# Altium schematic sheet servo_shield.schdoc
size 420 x 297 mm; Symbol: Drawing-Symbol_A4; Company: 嘉立创EDA; Version: V1.0; Page Size: A4; @Project Name: RobotDog_ServoShield; @Page Count: 1; @Update Date: 2025-12-03; @Create Date: 2025-11-25; @Schematic Name: Schematic1; @Page No: 1; @Page Name: P1; @Board Name: Board1; @Create Time: 19:45:21; @Update Time: 12:55:40; Border: 1; Title Block Position: 3; Size: A4; Width: 1655; Height: 1170; Region Start: 1; X Region Count: 6; Y Region Count: 4; Blade Width: 10; Title Block: 1; Device: Drawing-Symbol_A4
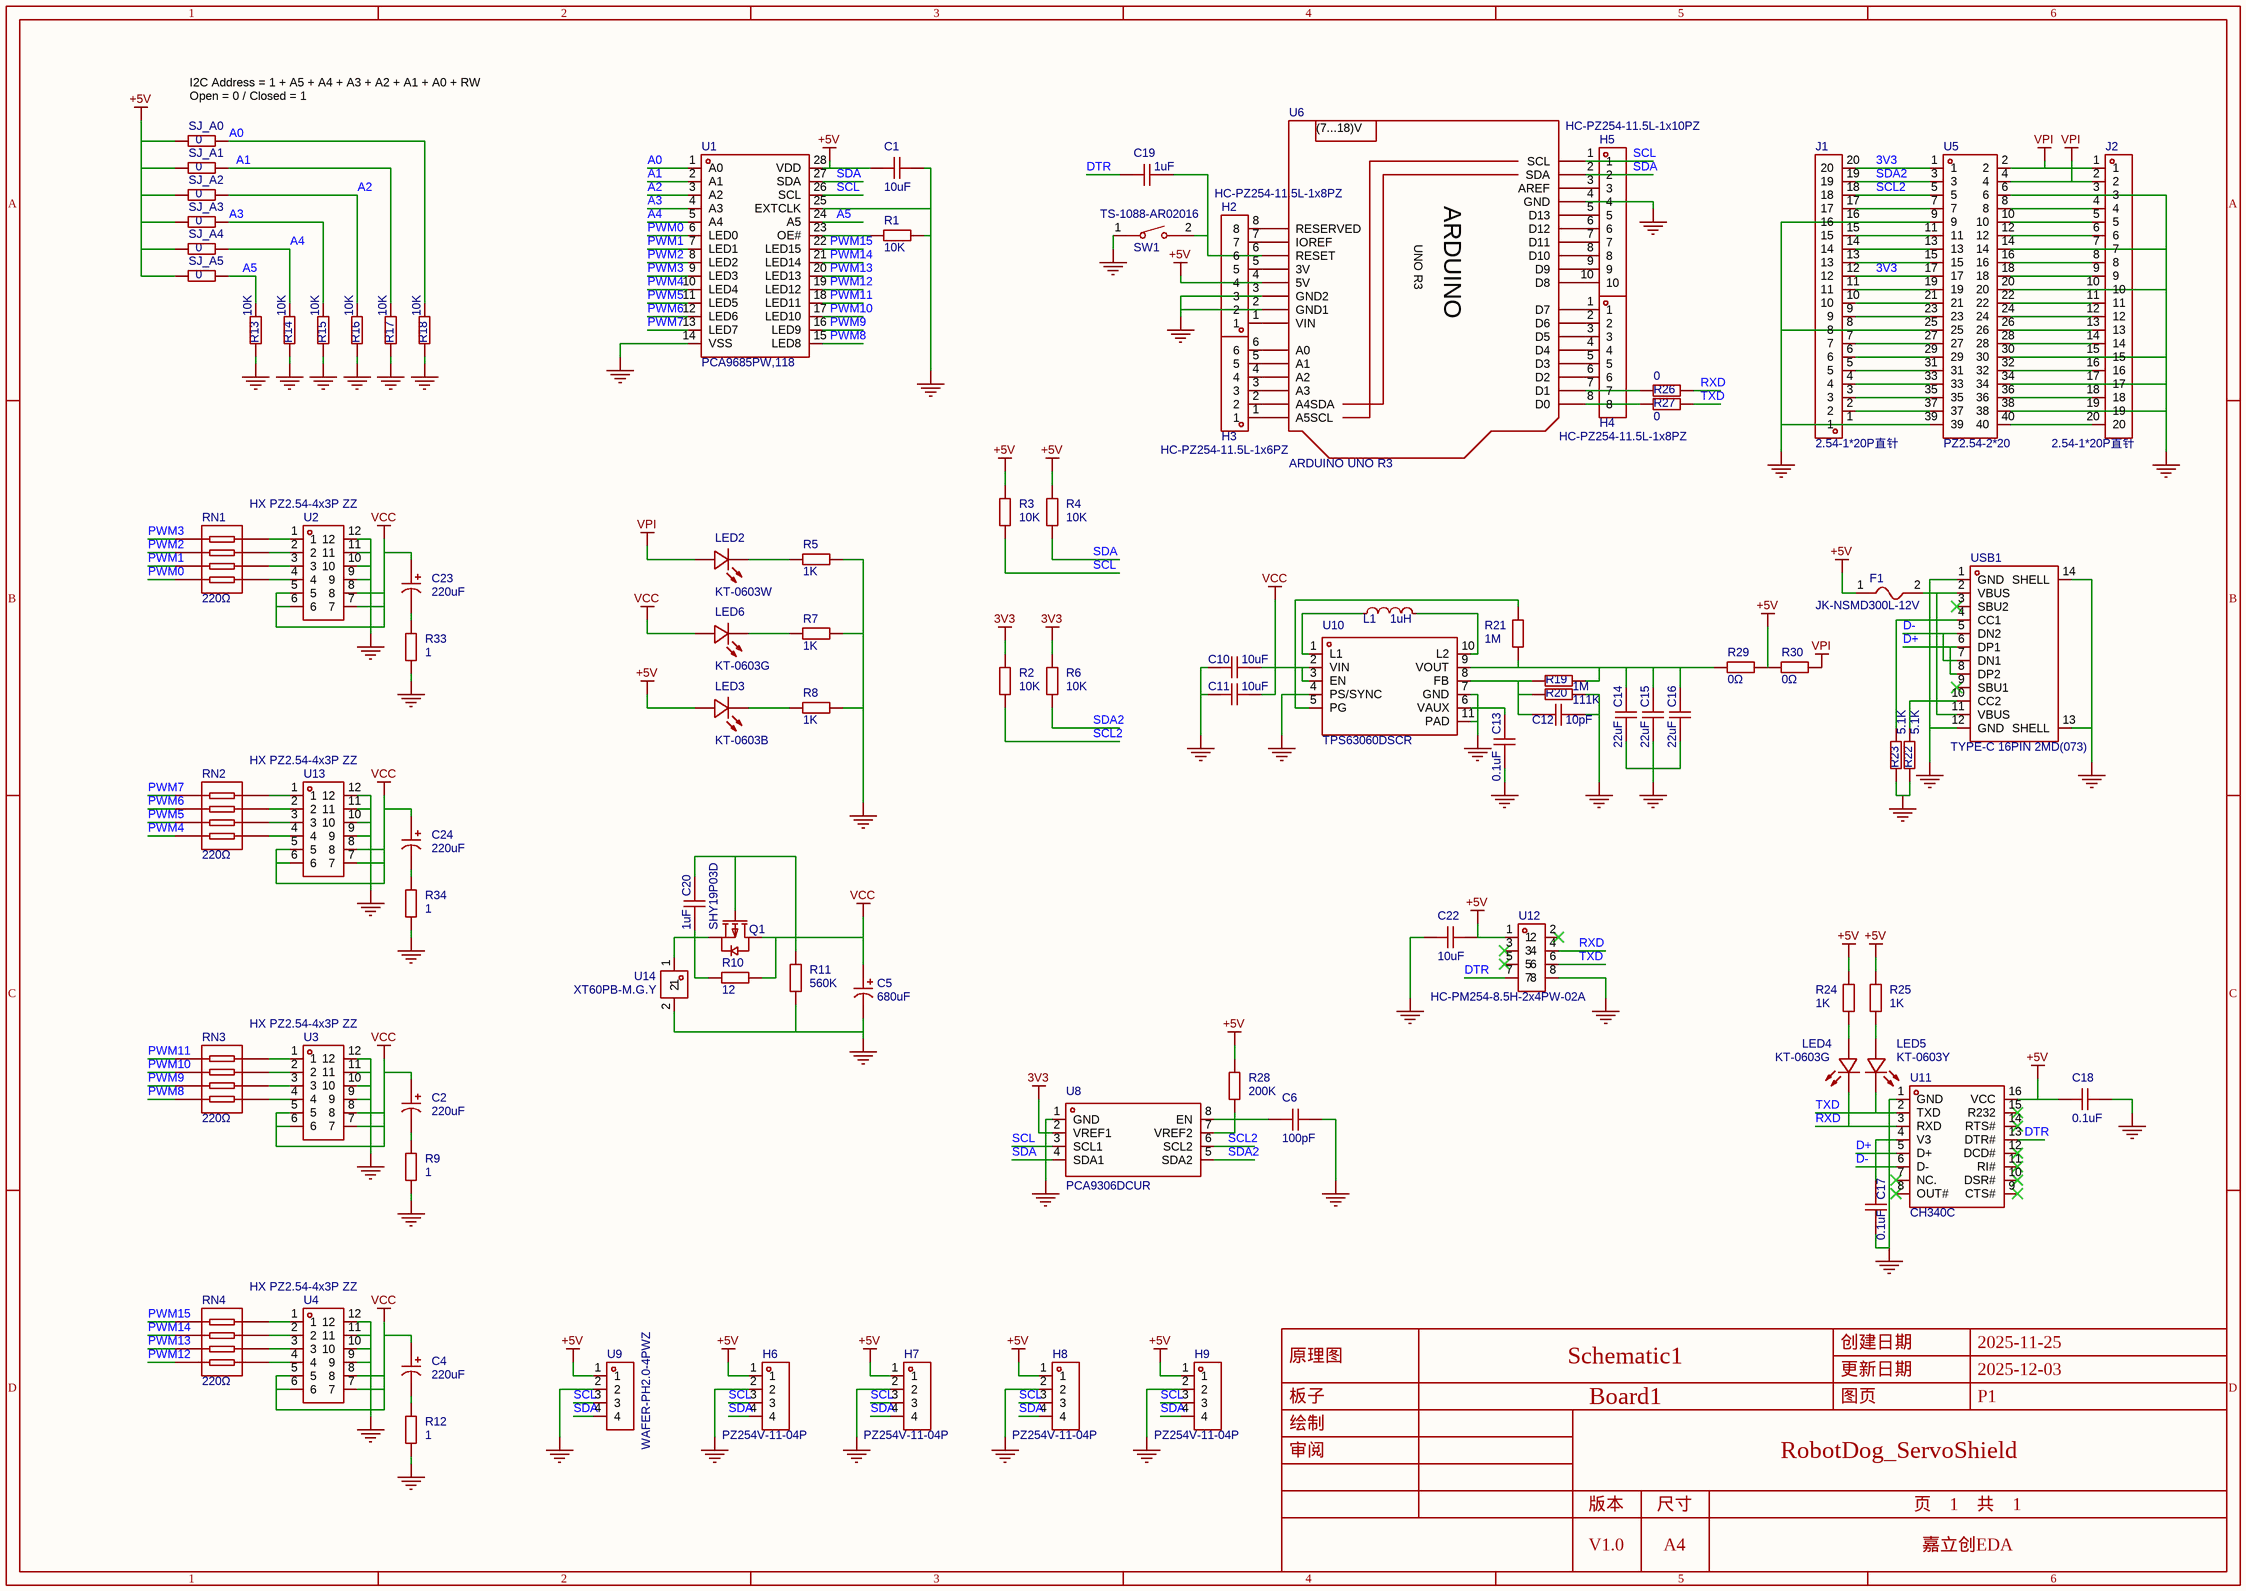
[diagram p0: servo_shield.schdoc]

## Parts
C1  10uF  [C0603]
C2  220uF  [CAP-TH_BD6.3-P2.50-D0.6-FD-1]
C4  220uF  [CAP-TH_BD6.3-P2.50-D0.6-FD-1]
C5  680uF  [CAP-TH_BD8.0-P3.50-D0.6-FD]
C6  100pF  [C0603]
C10  10uF  [C0603]
C11  10uF  [C0603]
C12  10pF  [C0603]
C13  0.1uF  [C0603]
C14  22uF  [C0603]
C15  22uF  [C0603]
C16  22uF  [C0603]
C17  0.1uF  [C0603]
C18  0.1uF  [C0603]
C19  1uF  [C0603]
C20  1uF  [C0603]
C22  10uF  [C0603]
C23  220uF  [CAP-TH_BD6.3-P2.50-D0.6-FD-1]
C24  220uF  [CAP-TH_BD6.3-P2.50-D0.6-FD-1]
F1  JK-NSMD300L-12V  [F1206]
H2  HC-PZ254-11.5L-1x8PZ  [HDR-TH_8P-P2.54-V-M]
H3  HC-PZ254-11.5L-1x6PZ  [HDR-TH_6P-P2.54-V-M]
H4  HC-PZ254-11.5L-1x8PZ  [HDR-TH_8P-P2.54-V-M]
H5  HC-PZ254-11.5L-1x10PZ  [HDR-TH_10P-P2.54-V-M]
H6  PZ254V-11-04P  [HDR-TH_4P-P2.54-V-M]
H7  PZ254V-11-04P  [HDR-TH_4P-P2.54-V-M]
H8  PZ254V-11-04P  [HDR-TH_4P-P2.54-V-M]
H9  PZ254V-11-04P  [HDR-TH_4P-P2.54-V-M]
J1  2.54-1*20P直针  [HDR-TH_20P-P2.54-V-M-1]
J2  2.54-1*20P直针  [HDR-TH_20P-P2.54-V-M-1]
L1  1uH  [L0603]
LED2  KT-0603W  [LED0603-R-RD_WHITE]
LED3  KT-0603B  [LED0603-RD]
LED4  KT-0603G  [LED0603-RD]
LED5  KT-0603Y  [LED0603-R-RD]
LED6  KT-0603G  [LED0603-RD]
Q1  SHY19P03D  [TO-252-2_L6.6-W6.1-P4.60-LS10.0-BR-CW]
R1  10K  [R0603]
R2  10K  [R0603]
R3  10K  [R0603]
R4  10K  [R0603]
R5  1K  [R0603]
R6  10K  [R0603]
R7  1K  [R0603]
R8  1K  [R0603]
R9  1  [R0603]
R10  12  [R0603]
R11  560K  [R0603]
R12  1  [R0603]
R13  10K  [R0603]
R14  10K  [R0603]
R15  10K  [R0603]
R16  10K  [R0603]
R17  10K  [R0603]
R18  10K  [R0603]
R19  1M  [R0603]
R20  111K  [R0603]
R21  1M  [R0603]
R22  5.1K  [R0603]
R23  5.1K  [R0603]
R24  1K  [R0603]
R25  1K  [R0603]
R26  0  [R0603]
R27  0  [R0603]
R28  200K  [R0603]
R29  0Ω  [R0603]
R30  0Ω  [R0603]
R33  1  [R0603]
R34  1  [R0603]
RN1  220Ω  [RES-ARRAY-SMD_0603-8P-L3.2-W1.6-BL]
RN2  220Ω  [RES-ARRAY-SMD_0603-8P-L3.2-W1.6-BL]
RN3  220Ω  [RES-ARRAY-SMD_0603-8P-L3.2-W1.6-BL]
RN4  220Ω  [RES-ARRAY-SMD_0603-8P-L3.2-W1.6-BL]
SJ_A0  0  [R0603]
SJ_A1  0  [R0603]
SJ_A2  0  [R0603]
SJ_A3  0  [R0603]
SJ_A4  0  [R0603]
SJ_A5  0  [R0603]
SW1  TS-1088-AR02016  [SW-SMD_L3.9-W3.0-P4.45]
U1  PCA9685PW,118  [TSSOP-28_L9.7-W4.4-P0.65-LS6.4-TL]
U2  HX PZ2.54-4x3P ZZ  [HDR-TH_12P-P2.54-V-M-R4-C3-S2.54]
U3  HX PZ2.54-4x3P ZZ  [HDR-TH_12P-P2.54-V-M-R4-C3-S2.54]
U4  HX PZ2.54-4x3P ZZ  [HDR-TH_12P-P2.54-V-M-R4-C3-S2.54]
U5  PZ2.54-2*20  [HDR-TH_40P-P2.54-V-M-R2-C20-S2.54]
U6  ARDUINO UNO R3  [ARDUINOR3]
U8  PCA9306DCUR  [SSOP-8_L2.0-W2.3-P0.50-LS3.1-BR]
U9  WAFER-PH2.0-4PWZ  [CONN-TH_4P-P2.00_BX-PH2.0-4PWZ]
U10  TPS63060DSCR  [WSON-10_L3.0-W3.0-P0.50-BL-EP-A]
U11  CH340C  [SOP-16_L10.0-W3.9-P1.27-LS6.0-BL]
U12  HC-PM254-8.5H-2x4PW-02A  [HDR-TH_8P-P2.54-H-F-R2-C4-S2.54-W8.5]
U13  HX PZ2.54-4x3P ZZ  [HDR-TH_12P-P2.54-V-M-R4-C3-S2.54]
U14  XT60PB-M.G.Y  [CONN-TH_XT60PB-M]
USB1  TYPE-C 16PIN 2MD(073)  [USB-C-SMD_TYPE-C-6PIN-2MD-073]

## Nets
3V3: J1.12 J1.20 R2.2 R6.2 U5.1 U5.17 U8.2(VREF1)
+5V: C1.1 C18.1 C22.2 F1.1 H2.4 H6.1 H7.1 H8.1 H9.1 LED3.2(A) R3.2 R4.2 R24.2 R25.2 R28.2 R29.2 R30.1 SJ_A0.1 SJ_A1.1 SJ_A2.1 SJ_A3.1 SJ_A4.1 SJ_A5.1 U1.28(VDD) U6.5V U9.1 U11.16(VCC) U12.1
GND: C1.2 C5.2 C6.2 C10.2 C11.2 C12.1 C13.1 C14.1 C15.1 C16.1 C17.1 C18.2 C22.1 H2.2 H2.3 H5.4 H6.2 H7.2 H8.2 H9.2 J1.1 J1.8 J1.16 J2.3 J2.7 J2.10 J2.15 J2.17 J2.19 R1.2 R5.2 R7.2 R8.2 R9.1 R11.1 R12.1 R13.1 R14.1 R15.1 R16.1 R17.1 R18.1 R20.2 R22.1 R23.1 R33.1 R34.1 SW1.1 U1.14(VSS) U1.25(EXTCLK) U2.9 U2.10 U2.11 U2.12 U3.9 U3.10 U3.11 U3.12 U4.9 U4.10 U4.11 U4.12 U5.6 U5.9 U5.14 U5.20 U5.25 U5.30 U5.34 U5.38 U5.39 U6.GND U6.GND1 U6.GND2 U8.1(GND) U9.2 U10.4(PS/SYNC) U10.7(GND) U10.11(PAD) U11.1(GND) U12.8 U13.9 U13.10 U13.11 U13.12 U14.2 USB1.1(GND) USB1.12(GND) USB1.13(SHELL) USB1.14(SHELL)
VCC: C2.1 C4.1 C5.1 C10.1 C11.1 C23.1 C24.1 LED6.2(A) Q1.2(D) R10.1 U2.5 U2.6 U2.7 U2.8 U3.5 U3.6 U3.7 U3.8 U4.5 U4.6 U4.7 U4.8 U10.2(VIN) U10.3(EN) U13.5 U13.6 U13.7 U13.8
VPI: J2.1 J2.2 LED2.1(A) R30.2 U5.2 U5.4
A0: R18.2 SJ_A0.2 U1.1(A0)
A1: R17.2 SJ_A1.2 U1.2(A1)
A2: R16.2 SJ_A2.2 U1.3(A2)
A3: R15.2 SJ_A3.2 U1.4(A3)
A4: R14.2 SJ_A4.2 U1.5(A4)
A5: R13.2 SJ_A5.2 U1.24(A5)
D+: U11.5(D+) USB1.6(DP1) USB1.8(DP2)
D-: U11.6(D-) USB1.5(DN2) USB1.7(DN1)
DTR: C19.1 U11.13(DTR#) U12.7
PWM0: RN1.4 U1.6(LED0)
PWM1: RN1.3 U1.7(LED1)
PWM2: RN1.2 U1.8(LED2)
PWM3: RN1.1 U1.9(LED3)
PWM4: RN2.4 U1.10(LED4)
PWM5: RN2.3 U1.11(LED5)
PWM6: RN2.2 U1.12(LED6)
PWM7: RN2.1 U1.13(LED7)
PWM8: RN3.4 U1.15(LED8)
PWM9: RN3.3 U1.16(LED9)
PWM10: RN3.2 U1.17(LED10)
PWM11: RN3.1 U1.18(LED11)
PWM12: RN4.4 U1.19(LED12)
PWM13: RN4.3 U1.20(LED13)
PWM14: RN4.2 U1.21(LED14)
PWM15: RN4.1 U1.22(LED15)
RXD: LED4.1(K) R26.2 U11.3(RXD) U12.4
SCL: H5.1 H6.3 H7.3 H8.3 H9.3 R3.1 U1.26(SCL) U6.SCL U8.3(SCL1) U9.3
SCL2: J1.18 R2.1 U5.5 U8.6(SCL2)
SDA: H5.2 H6.4 H7.4 H8.4 H9.4 R4.1 U1.27(SDA) U6.SDA U8.4(SDA1) U9.4
SDA2: J1.19 R6.1 U5.3 U8.5(SDA2)
TXD: LED5.2(K) R27.2 U11.2(TXD) U12.6
NetC2_2: C2.2 R9.2
NetC4_2: C4.2 R12.2
NetC6_1: C6.1 R28.1 U8.7(VREF2) U8.8(EN)
NetC12_2: C12.2 R19.1 R20.1 U10.8(FB)
NetC13_2: C13.2 U10.6(VAUX)
NetC14_2: C14.2 C15.2 C16.2 R19.2 R21.1 R29.1 U10.9(VOUT)
NetC17_2: C17.2 U11.4(V3)
NetC19_2: C19.2 H2.6 SW1.2 U6.RESET
NetC20_1: C20.1 Q1.3(S) R10.2 U14.1
NetC20_2: C20.2 Q1.1(G) R11.2
NetC23_2: C23.2 R33.2
NetC24_2: C24.2 R34.2
NetF1_2: F1.2 USB1.2(VBUS) USB1.11(VBUS)
NetH2_1: H2.1 U6.VIN
NetH2_5: H2.5 U6.3V
NetH2_7: H2.7 U6.IOREF
NetH2_8: H2.8 U6.RESERVED
NetH3_1: H3.1 U6.A5(A5SCL)
NetH3_2: H3.2 U6.A4(A4SDA)
NetH3_3: H3.3 U6.A3
NetH3_4: H3.4 U6.A2
NetH3_5: H3.5 U6.A1
NetH3_6: H3.6 U6.A0
NetH4_1: H4.1 U6.D7
NetH4_2: H4.2 U6.D6
NetH4_3: H4.3 U6.D5
NetH4_4: H4.4 U6.D4
NetH4_5: H4.5 U6.D3
NetH4_6: H4.6 U6.D2
NetH4_7: H4.7 R26.1 U6.D1
NetH4_8: H4.8 R27.1 U6.D0
NetH5_3: H5.3 U6.AREF
NetH5_5: H5.5 U6.D13
NetH5_6: H5.6 U6.D12
NetH5_7: H5.7 U6.D11
NetH5_8: H5.8 U6.D10
NetH5_9: H5.9 U6.D9
NetH5_10: H5.10 U6.D8
NetJ1_2: J1.2 U5.37
NetJ1_3: J1.3 U5.35
NetJ1_4: J1.4 U5.33
NetJ1_5: J1.5 U5.31
NetJ1_6: J1.6 U5.29
NetJ1_7: J1.7 U5.27
NetJ1_9: J1.9 U5.23
NetJ1_10: J1.10 U5.21
NetJ1_11: J1.11 U5.19
NetJ1_13: J1.13 U5.15
NetJ1_14: J1.14 U5.13
NetJ1_15: J1.15 U5.11
NetJ1_17: J1.17 U5.7
NetJ2_4: J2.4 U5.8
NetJ2_5: J2.5 U5.10
NetJ2_6: J2.6 U5.12
NetJ2_8: J2.8 U5.16
NetJ2_9: J2.9 U5.18
NetJ2_11: J2.11 U5.22
NetJ2_12: J2.12 U5.24
NetJ2_13: J2.13 U5.26
NetJ2_14: J2.14 U5.28
NetJ2_16: J2.16 U5.32
NetJ2_18: J2.18 U5.36
NetJ2_20: J2.20 U5.40
NetL1_1: L1.1 U10.1(L1)
NetL1_2: L1.2 U10.10(L2)
NetLED2_2: LED2.2(K) R5.1
NetLED3_1: LED3.1(K) R8.1
NetLED4_2: LED4.2(A) R24.1
NetLED5_1: LED5.1(A) R25.1
NetLED6_1: LED6.1(K) R7.1
NetR1_1: R1.1 U1.23(OE#)
NetR21_2: R21.2 U10.5(PG)
NetR22_2: R22.2 USB1.10(CC2)
NetR23_2: R23.2 USB1.4(CC1)
NetRN1_5: RN1.5 U2.4
NetRN1_6: RN1.6 U2.3
NetRN1_7: RN1.7 U2.2
NetRN1_8: RN1.8 U2.1
NetRN2_5: RN2.5 U13.4
NetRN2_6: RN2.6 U13.3
NetRN2_7: RN2.7 U13.2
NetRN2_8: RN2.8 U13.1
NetRN3_5: RN3.5 U3.4
NetRN3_6: RN3.6 U3.3
NetRN3_7: RN3.7 U3.2
NetRN3_8: RN3.8 U3.1
NetRN4_5: RN4.5 U4.4
NetRN4_6: RN4.6 U4.3
NetRN4_7: RN4.7 U4.2
NetRN4_8: RN4.8 U4.1

Not connected (* = marked no-connect by the designer): U11 7(NC.)* 8(OUT#)* 9(CTS#)* 10(DSR#)* 11(RI#)* 12(DCD#)* 14(RTS#)* 15(R232)*; U12 2* 3* 5*; USB1 3(SBU2)* 9(SBU1)*

## Notes on the sheet
- I2C Address = 1 + A5 + A4 + A3 + A2 + A1 + A0 + RW
  Open = 0 / Closed = 1
- 1
- 2
- 3
- 4
- 5
- 6
- A
- B
- C
- 创建日期
- 2025-11-25
- D
- 原理图
- 板子
- Schematic1
- Board1
- 更新日期
- 图页
- 2025-12-03
- P1
- 绘制
- 审阅
- RobotDog_ServoShield
- 版本
- V1.0
- 尺寸
- A4
- 页    1    共    1
- 嘉立创EDA
- (in symbol ARDUINO UNO R3) (7...18)V; ARDUINO; UNO R3

## Library data of the parts
C1 C10-C19 = CAP_0603: ConvertToPcb: yes; SymbolName: Capacitance; ModelId: ac125912035d415993ca9572d50418b1; ModelName: C0603_L1.6-W0.8-H0.8; ModelTransform: 62.992,31.496,0,0,0,0,0,0,0; Device: CAP_0603; AddInBom: yes; Supplier Footprint: 0603; FootprintName: C0603
  C1 C10 C11: Value: 10uF
  C12: Value: 10pF
  C13 C17 C18: Value: 0.1uF
  C14-C16: Value: 22uF
  C19: Value: 1uF
C2 C4 C23 C24 = PA25V220M6x8: 容值:220uF;精度:±20%;额定电压:25V;纹波电流:2.9A@100kHz;等效串联电阻(ESR):25mΩ@100kHz;类型:聚合物;; Manufacturer: JIERR(捷而瑞); AddInBom: yes; ModelId: c2609a67fafc443cb408b115f2cfd21c; ModelTransform: 247.85521,247.943,0,0,0,0,0,0,-196.85; Tolerance: ±20%; Voltage Rating: 25V; Type: 聚合物; Lifetime: 2000hrs@105℃; Symbol: PA25V220M6X8; Device: PA25V220M6x8; LCSC Part Name: 220uF ±20% 25V; SupplierPart: C46550441; ManufacturerPart: PA25V220M6x8; Supplier Footprint: 插件,D6.3xL8mm; JLCPCB Part Class: 扩展库; Datasheet: https://item.szlcsc.com/datasheet/PA25V220M6x8/48680135.html; Supplier: LCSC; ConvertToPcb: yes; FootprintName: CAP-TH_BD6.3-P2.50-D0.6-FD-1; ModelName: CAP-TH_BD6.3-P2.50-D0.6-FD-1; Value: 220uF; Ripple Current: 2.9A@100kHz; Equivalent Series Resistance(ESR): 25mΩ@100kHz; Diameter: 6.3mm; Height - Seated (Max): 8mm; Operating Temperature: -55℃~+105℃
C5 = PA25V680M8x12: 容值:680uF;精度:±20%;额定电压:25V;纹波电流:4.1A@100kHz;等效串联电阻(ESR):20mΩ@100kHz;类型:聚合物;; Manufacturer: JIERR(捷而瑞); 3D Model: a2c936ec27754f809f3966430e36f7670819f05c4eef4c71ace90d822a990e87; 3D Model Transform: 314.96,314.862,0,180,0,0,0,0,-137.795; Tolerance: ±20%; Voltage Rating: 25V; Type: 聚合物; Lifetime: 2000hrs@105℃; AddInBom: yes; ModelName: CAP-TH_D8.0-H8.0-P3.50; Symbol: PA25V680M8X12; Device: PA25V680M8x12; LCSC Part Name: 680uF ±20% 25V; Supplier Part: C46550437; Manufacturer Part: PA25V680M8x12; Supplier Footprint: 插件,D8xL12.5mm; JLCPCB Part Class: Extended Part; Datasheet: https://item.szlcsc.com/datasheet/PA25V680M8x12/48680131.html; Supplier: LCSC; Value: 680uF; Ripple Current: 4.1A@100kHz; Equivalent Series Resistance(ESR): 20mΩ@100kHz; Diameter: 8mm; Height - Seated (Max): 12.5mm; Operating Temperature: -55℃~+105℃; ConvertToPcb: yes; FootprintName: CAP-TH_BD8.0-P3.50-D0.6-FD
C6 = CAP_0603: Symbol: Capacitance; 3D Model: ac125912035d415993ca9572d50418b1; 3D Model Transform: 62.992,31.496,0,0,0,0,0,0,0; ConvertToPcb: yes; ModelName: C0603_L1.6-W0.8-H0.8; Device: CAP_0603; Supplier Footprint: 0603; Value: 100pF; AddInBom: yes; FootprintName: C0603
C20 C22 = CAP_0603: Symbol: Capacitance; ConvertToPcb: yes; ModelId: ac125912035d415993ca9572d50418b1; ModelName: C0603_L1.6-W0.8-H0.8; ModelTransform: 62.992,31.496,0,0,0,0,0,0,0; Device: CAP_0603; AddInBom: yes; Supplier Footprint: 0603; FootprintName: C0603
  C20: Value: 1uF
  C22: Value: 10uF
F1 = JK-NSMD300L-12V: 耐压:12V;最大电流:50A;保持电流(Ih):3A;跳闸电流:6A;; Manufacturer: JK(金科); AddInBom: yes; ModelId: f1628daad26847a79b887277a2bc8541; ModelName: F1206_L3.2-W1.7-H0.6; ModelTransform: 125.984,66.929,0,0,0,0,0,0,0; Voltage - Max: 12V; Current - Max: 50A; Hold Current: 3A; Trip Current: 6A; Power Dissipation: 800mW; Resistance - Initial (Ri) (Min): 4mΩ; Resistance - Post Trip (R1) (Max): 20mΩ; Time to Trip(Max): 2s; Symbol: JK-NSMD300L-12V; Device: JK-NSMD300L-12V; LCSC Part Name: 12V 3A 1206自恢复; SupplierPart: C516068; ManufacturerPart: JK-NSMD300L-12V; Supplier Footprint: 1206; JLCPCB Part Class: 扩展库; Datasheet: https://atta.szlcsc.com/upload/public/pdf/source/20200708/C516068_037646B1D770C1964CD963FC5BED9971.pdf; Supplier: LCSC; ConvertToPcb: yes; FootprintName: F1206; Operating Temperature: -40℃~+85℃
H2 H4 = HC-PZ254-11.5L-1x8PZ: 插针结构:1x8P;间距:2.54mm;行距:-;圆针/方针:方针;安装方式:直插;排数:单排;总PIN位数:8P;额定电流:3A;额定电压:-;配合针长度:6mm;塑高:2.5mm;端接针长度:3mm;触头材质:黄铜;触头镀层:金;工作温度:-40℃~+105℃;颜色:黑色;; Manufacturer: HC(虹成电子); AddInBom: yes; ModelId: f5b96e27511e49e38545e53df2320202; ModelTransform: 807.87244,98.425,0,0,0,0,0,0,-118.11; Pin Structure: 1x8P; Pitch: 2.54mm; Circluar Pins/Square Pins: 方针; Current Rating: 3A; Symbol: HC-PZ254-11.5L-1X8PZ; Device: HC-PZ254-11.5L-1x8PZ; LCSC Part Name: 1x8P 间距:2.54mm 方针 直插; SupplierPart: C27985192; ManufacturerPart: HC-PZ254-11.5L-1x8PZ; Supplier Footprint: 插件,P=2.54mm; JLCPCB Part Class: 扩展库; Datasheet: https://item.szlcsc.com/datasheet/HC-PZ254-11.5L-1x8PZ/29721150.html; Supplier: LCSC; ConvertToPcb: yes; FootprintName: HDR-TH_8P-P2.54-V-M; ModelName: HDR-TH_8P-P2.54-V-M; Row Spacing: -; Mounting Type: 直插; Number of Rows: 单排; Number of Pins: 8P; Voltage Rating (Max): -; Length of Mating Pin: 6mm; Insulation Height: 2.5mm; Length of End Connection Pin: 3mm; Contact Material: 黄铜; Contact Plating: 金; Operating Temperature: -40℃~+105℃; Color: 黑色
H3 = HC-PZ254-11.5L-1x6PZ: 插针结构:1x6P;间距:2.54mm;行距:-;圆针/方针:方针;安装方式:直插;排数:单排;总PIN位数:6P;额定电流:3A;额定电压:-;配合针长度:6mm;塑高:2.5mm;端接针长度:3mm;触头材质:黄铜;触头镀层:金;工作温度:-40℃~+105℃;颜色:黑色;; Manufacturer: HC(虹成电子); AddInBom: yes; ModelId: 66a147c6933d4029b68665bbcd1e2924; ModelName: HDR-TH_6P-P2.54-M-LI-1X6P; ModelTransform: 590.1563,98.425,0,0,0,0,0,0,-118.11; Pin Structure: 1x6P; Pitch: 2.54mm; Circluar Pins/Square Pins: 方针; Current Rating: 3A; Symbol: HC-PZ254-11.5L-1X6PZ; Device: HC-PZ254-11.5L-1x6PZ; LCSC Part Name: 1x6P 间距:2.54mm 方针 直插; SupplierPart: C27985191; ManufacturerPart: HC-PZ254-11.5L-1x6PZ; Supplier Footprint: 插件,P=2.54mm; JLCPCB Part Class: 扩展库; Datasheet: https://item.szlcsc.com/datasheet/HC-PZ254-11.5L-1x6PZ/29721149.html; Supplier: LCSC; ConvertToPcb: yes; FootprintName: HDR-TH_6P-P2.54-V-M; Row Spacing: -; Mounting Type: 直插; Number of Rows: 单排; Number of Pins: 6P; Voltage Rating (Max): -; Length of Mating Pin: 6mm; Insulation Height: 2.5mm; Length of End Connection Pin: 3mm; Contact Material: 黄铜; Contact Plating: 金; Operating Temperature: -40℃~+105℃; Color: 黑色
H5 = HC-PZ254-11.5L-1x10PZ: 插针结构:1x10P;间距:2.54mm;行距:-;圆针/方针:方针;安装方式:直插;排数:单排;总PIN位数:10P;额定电流:3A;额定电压:-;配合针长度:6mm;塑高:2.5mm;端接针长度:3mm;触头材质:黄铜;触头镀层:金;工作温度:-40℃~+105℃;颜色:黑色;; Manufacturer: HC(虹成电子); AddInBom: yes; ModelId: 10f3d1cea59e4bb4ba116af9f09c2b9b; ModelName: HDR2.54-M-LI-1X10P; ModelTransform: 999.99796,100,0,0,0,0,0,0,-118.11; Pin Structure: 1x10P; Pitch: 2.54mm; Circluar Pins/Square Pins: 方针; Current Rating: 3A; Symbol: HC-PZ254-11.5L-1X10PZ; Device: HC-PZ254-11.5L-1x10PZ; LCSC Part Name: 1x10P 间距:2.54mm 方针 直插; SupplierPart: C27985194; ManufacturerPart: HC-PZ254-11.5L-1x10PZ; Supplier Footprint: 插件,P=2.54mm; JLCPCB Part Class: 扩展库; Datasheet: https://item.szlcsc.com/datasheet/HC-PZ254-11.5L-1x10PZ/29721152.html; Supplier: LCSC; ConvertToPcb: yes; FootprintName: HDR-TH_10P-P2.54-V-M; Row Spacing: -; Mounting Type: 直插; Number of Rows: 单排; Number of Pins: 10P; Voltage Rating (Max): -; Length of Mating Pin: 6mm; Insulation Height: 2.5mm; Length of End Connection Pin: 3mm; Contact Material: 黄铜; Contact Plating: 金; Operating Temperature: -40℃~+105℃; Color: 黑色
H6-H9 = PZ254V-11-04P: 插针结构:1x4P;间距:2.54mm;行距:-;圆针/方针:方针;安装方式:直插;排数:单排;总PIN位数:4P;额定电流:3A;额定电压:250V;配合针长度:6mm;塑高:2.5mm;端接针长度:3mm;触头材质:-;工作温度:-40℃~+105℃;颜色:黑色;; Manufacturer: XFCN(兴飞); Symbol: PZ254V-11-04P_C2691448; AddInBom: yes; ModelId: 112f4d05e8d64e99ab9a333894bea4f9; ModelName: HDR-TH_4P-P2.54-M-LI-1X4P; ModelTransform: 399.999,104.7242,0,0,0,0,0,0,-118.11; Pin Structure: 1x4P; Pitch: 2.54mm; Circluar Pins/Square Pins: 方针; Current Rating: 3A; Voltage Rating (Max): 250V; Device: PZ254V-11-04P; LCSC Part Name: 1x4P 间距:2.54mm 方针 直插; SupplierPart: C2691448; ManufacturerPart: PZ254V-11-04P; Supplier Footprint: 插件,P=2.54mm; JLCPCB Part Class: 扩展库; Datasheet: https://item.szlcsc.com/datasheet/PZ254V-11-04P/2801085.html; Supplier: LCSC; ConvertToPcb: yes; FootprintName: HDR-TH_4P-P2.54-V-M; Row Spacing: -; Mounting Type: 直插; Number of Rows: 单排; Number of Pins: 4P; Length of Mating Pin: 6mm; Insulation Height: 2.5mm; Length of End Connection Pin: 3mm; Contact Material: -; Operating Temperature: -40℃~+105℃; Color: 黑色
J1 J2 = 2.54-1*20P直针: 插针结构:1x20P;间距:2.54mm;行距:-;圆针/方针:方针;安装方式:直插;排数:单排;总PIN位数:20P;额定电流:3A;额定电压:-;配合针长度:-;塑高:-;端接针长度:-;触头材质:黄铜;触头镀层:-;工作温度:-40℃~+105℃;颜色:黑色;; Manufacturer: BOOMELE(博穆精密); Symbol: Header-Male-2.54_1x20; AddInBom: yes; ModelId: f68709be121d406db68b06f32a5953890819f05c4eef4c71ace90d822a990e87; ModelName: HDR-M-2.54_1x20; ModelTransform: 1999.996,100,0,0,0,0,0,0,-118.11; Pin Structure: 1x20P; Pitch: 2.54mm; Circluar Pins/Square Pins: 方针; Current Rating: 3A; Device: 2.54-1*20P直针; LCSC Part Name: 1x20P 间距:2.54mm 方针 直插; SupplierPart: C50981; ManufacturerPart: 2.54-1*20P直针; Supplier Footprint: 插件,P=2.54mm; JLCPCB Part Class: Extended Part; Datasheet: https://item.szlcsc.com/datasheet/2.54-1*20P%25E7%259B%25B4%25E9%2592%2588/51993.html; Supplier: LCSC; ConvertToPcb: yes; FootprintName: HDR-TH_20P-P2.54-V-M-1; Row Spacing: -; Mounting Type: 直插; Number of Rows: 单排; Number of Pins: 20P; Voltage Rating (Max): -; Length of Mating Pin: -; Insulation Height: -; Length of End Connection Pin: -; Contact Material: 黄铜; Contact Plating: -; Operating Temperature: -40℃~+105℃; Color: 黑色
L1 = L_0603: Symbol: SDFL1608S100KTF; AddInBom: yes; ModelId: 2bc5ec593d464d6ba9807aec0b5673c2; ModelName: L0603_L1.6-W0.8-H0.5_BEAD; ModelTransform: 62.992,31.496,0,180,0,0,0.094,0.629,0; Value: 1uH; Device: L_0603; Supplier Footprint: L0603; ConvertToPcb: yes; FootprintName: L0603
LED2 = KT-0603W: 发光颜色:白色;正向压降(Vf):2.6V~3.1V;功率:100mW;正向电流:5mA;二极管配置:独立二极管;透镜颜色:黄色透镜;发光强度:360mcd;发光角度:120°;载带方式:正贴;; Manufacturer: KENTO; Symbol: 0603White light_C2290; 3D Model: 69daf87d236b4f268260e1d4a354a21e; 3D Model Transform: 63.7794,31.496,0,0,0,0,0,0,0; Illumination Color: 白色; Power(Watts): 100mW; Forward Current: 5mA; Diode Configuration: 独立二极管; Lens Color: 黄色透镜; Luminous Intensity: 360mcd; Viewing Angle: 120°; AddInBom: yes; Device: KT-0603W; LCSC Part Name: 0603 白灯 高亮; Supplier Part: C2290; Manufacturer Part: KT-0603W; Supplier Footprint: 0603; JLCPCB Part Class: 基础库; Datasheet: https://item.szlcsc.com/datasheet/KT-0603W/2663.html; Supplier: LCSC; Voltage - Forward(Vf): 2.6V~3.1V; Mounting Style: 正贴; ConvertToPcb: yes; FootprintName: LED0603-R-RD_WHITE; ModelName: LED0603-R-RD_WHITE
LED3 = KT-0603B: 发光颜色:蓝色;正向压降(Vf):3.1V;功率:100mW;正向电流:5mA;波长:460nm~475nm;二极管配置:-;透镜颜色:无色透明透镜;色温:-;发光强度:175mcd;发光角度:120°;载带方式:-;工作温度:-;; Manufacturer: KENTO; Symbol: Blue light 0603; AddInBom: yes; ModelId: 1f0d29a91be547639d425604e9b96ebb; ModelTransform: 63.7794,32.283,0,0,0,0,0,0,0; Illumination Color: 蓝色; Voltage - Forward(Vf): 3.1V; Power(Watts): 100mW; Forward Current: 5mA; Peak Wavelength: 469nm; Lens Color: 无色透明透镜; Luminous Intensity: 175mcd; Viewing Angle: 120°; Device: KT-0603B; LCSC Part Name: 0603 蓝灯 高亮; SupplierPart: C2288; ManufacturerPart: KT-0603B; Supplier Footprint: 0603; JLCPCB Part Class: 扩展库; Datasheet: https://item.szlcsc.com/datasheet/KT-0603B/2661.html; Supplier: LCSC; ConvertToPcb: yes; FootprintName: LED0603-RD; ModelName: LED0603-RD; Wavelength - Dominant: 460nm~475nm; Diode Configuration: -; Color Temperature: -; Mounting Style: -; Operating Temperature: -
LED4 = KT-0603G: 发光颜色:翠绿色;正向压降(Vf):3.1V;功率:100mW;正向电流:5mA;波长:513nm~528nm;透镜颜色:无色透明透镜;发光强度:430mcd;发光角度:120°;工作温度:-40℃~+85℃;; Manufacturer: KENTO; Symbol: 0603 Green 509-620mcd; AddInBom: yes; ModelId: 1f0d29a91be547639d425604e9b96ebb; ModelTransform: 63.7794,32.283,0,0,0,0,0,0,0; Illumination Color: 翠绿色; Voltage - Forward(Vf): 3.1V; Power(Watts): 100mW; Forward Current: 5mA; Peak Wavelength: 525nm; Lens Color: 无色透明透镜; Luminous Intensity: 430mcd; Viewing Angle: 120°; Device: KT-0603G; LCSC Part Name: 0603 翠绿 高亮; SupplierPart: C12624; ManufacturerPart: KT-0603G; Supplier Footprint: 0603; JLCPCB Part Class: 扩展库; Datasheet: https://item.szlcsc.com/datasheet/KT-0603G/13258.html; Supplier: LCSC; ConvertToPcb: yes; FootprintName: LED0603-RD; ModelName: LED0603-RD; Wavelength - Dominant: 513nm~528nm; Operating Temperature: -40℃~+85℃
LED5 = KT-0603Y: 发光颜色:黄色;正向压降(Vf):2.4V;功率:40mW;波长:584nm~594nm;透镜颜色:无色透明透镜;发光强度:175mcd;发光角度:120°;工作温度:-40℃~+85℃;; Manufacturer: KENTO; Symbol: 0603YYellow light 90-110; AddInBom: yes; ModelId: 8d3b40c214c440ee9cb5435c7b23d347; ModelTransform: 63.7794,31.496,0,0,0,0,0,0,0; Illumination Color: 黄色; Voltage - Forward(Vf): 2.4V; Power(Watts): 40mW; Peak Wavelength: 596nm; Lens Color: 无色透明透镜; Luminous Intensity: 175mcd; Viewing Angle: 120°; Device: KT-0603Y; LCSC Part Name: 0603 黄灯 高亮; SupplierPart: C2287; ManufacturerPart: KT-0603Y; Supplier Footprint: 0603; JLCPCB Part Class: 扩展库; Datasheet: https://item.szlcsc.com/datasheet/KT-0603Y/2660.html; Supplier: LCSC; ConvertToPcb: yes; FootprintName: LED0603-R-RD; ModelName: LED0603-R-RD; Wavelength - Dominant: 584nm~594nm; Operating Temperature: -40℃~+85℃
LED6 = KT-0603G: 发光颜色:翠绿色;正向压降(Vf):3.1V;功率:100mW;正向电流:5mA;波长:513nm~528nm;透镜颜色:无色透明透镜;发光强度:430mcd;发光角度:120°;工作温度:-40℃~+85℃;; Manufacturer: KENTO; Symbol: 0603 Green 509-620mcd; 3D Model: 1f0d29a91be547639d425604e9b96ebb; 3D Model Transform: 63.7794,32.283,0,0,0,0,0,0,0; Illumination Color: 翠绿色; Voltage - Forward(Vf): 3.1V; Power(Watts): 100mW; Forward Current: 5mA; Peak Wavelength: 525nm; Lens Color: 无色透明透镜; Luminous Intensity: 430mcd; Viewing Angle: 120°; AddInBom: yes; Device: KT-0603G; LCSC Part Name: 0603 翠绿 高亮; Supplier Part: C12624; Manufacturer Part: KT-0603G; Supplier Footprint: 0603; JLCPCB Part Class: 扩展库; Datasheet: https://item.szlcsc.com/datasheet/KT-0603G/13258.html; Supplier: LCSC; Wavelength - Dominant: 513nm~528nm; Operating Temperature: -40℃~+85℃; ConvertToPcb: yes; FootprintName: LED0603-RD; ModelName: LED0603-RD
Q1 = SHY19P03D: 漏源电压(Vdss):30V;连续漏极电流(Id):15A;导通电阻(RDS(on)):5mΩ@10V;耗散功率(Pd):2.5W;; Manufacturer: JSMSEMI(杰盛微); 3D Model: 2bfbfbb77002446c96d8a76a432e0188; 3D Model Transform: 246.80147,383.8575,0,90,0,0,-31.302,0.003,0; Drain to Source Voltage: 30V; Current - Continuous Drain(Id): 15A; Pd - Power Dissipation: 2.5W; Gate Charge(Qg): 53nC; Input Capacitance(Ciss): 2.886nF; Reverse Transfer Capacitance (Crss@Vds): 440pF; Type: P沟道; Output Capacitance(Coss): 640pF; AddInBom: yes; Symbol: SHY19P03D; Device: SHY19P03D; LCSC Part Name: 30V P沟道增强型MOSFET; Supplier Part: C49206898; Manufacturer Part: SHY19P03D; Supplier Footprint: TO-252; JLCPCB Part Class: 扩展库; Datasheet: https://item.szlcsc.com/datasheet/SHY19P03D/51612297.html; Supplier: LCSC; RDS(on): 5mΩ@10V; Operating Temperature: -55℃~+150℃; ConvertToPcb: yes; FootprintName: TO-252-2_L6.6-W6.1-P4.60-LS10.0-BR-CW; ModelName: TO-252-2_L6.6-W6.1-P4.60-LS10.0-BR-CW
R1 R9 R12-R27 R33 R34 SJ_A0-SJ_A5 = Res_0603: ConvertToPcb: yes; SymbolName: 电阻; ModelId: fc143cca1e79419f9cd78b61e9279f08; ModelTransform: 31.8897,63.7794,0,90,0,0,0,0,0; Device: Res_0603; AddInBom: yes; Supplier Footprint: 0603; FootprintName: R0603; ModelName: R0603
  R1 R13-R18: Value: 10K
  R9 R12 R33 R34: Value: 1
  R19 R21: Value: 1M
  R20: Value: 111K
  R22 R23: Value: 5.1K
  R24 R25: Value: 1K
  R26 R27 SJ_A0-SJ_A5: Value: 0
R2 R5-R7 R10 R11 R28 = Res_0603: Symbol: 电阻; 3D Model: fc143cca1e79419f9cd78b61e9279f08; 3D Model Transform: 31.8897,63.7794,0,90,0,0,0,0,0; ConvertToPcb: yes; Device: Res_0603; Supplier Footprint: 0603; AddInBom: yes; FootprintName: R0603; ModelName: R0603
  R2 R6: Value: 10K
  R5 R7: Value: 1K
  R10: Value: 12
  R11: Value: 560K
  R28: Value: 200K
R3 R4 R8 = Res_0603: Symbol: 电阻; ConvertToPcb: yes; ModelId: fc143cca1e79419f9cd78b61e9279f08; ModelTransform: 31.8897,63.7794,0,90,0,0,0,0,0; Device: Res_0603; AddInBom: yes; Supplier Footprint: 0603; FootprintName: R0603; ModelName: R0603
  R3 R4: Value: 10K
  R8: Value: 1K
R29 R30 = 0603WAF0000T5E: 电阻类型:厚膜电阻;阻值:0Ω;精度:±1%;功率:100mW;工作电压:75V;温度系数:-;; Manufacturer: UNI-ROYAL(厚声); AddInBom: yes; ModelId: fc143cca1e79419f9cd78b61e9279f080819f05c4eef4c71ace90d822a990e87; ModelTransform: 31.8897,63.7794,0,90,0,0,0,0,0; Tolerance: ±1%; Power(Watts): 100mW; Voltage-Supply(Max): 75V; Symbol: 0603WAF0000T5E; Device: 0603WAF0000T5E; LCSC Part Name: 0Ω ±1% 100mW 厚膜电阻; SupplierPart: C21189; ManufacturerPart: 0603WAF0000T5E; Supplier Footprint: 0603; JLCPCB Part Class: Basic Part; Datasheet: https://item.szlcsc.com/datasheet/0603WAF0000T5E/21903.html; Supplier: LCSC; ConvertToPcb: yes; FootprintName: R0603; ModelName: R0603; Type: 厚膜电阻; Value: 0Ω; Temperature Coefficient: -; Operating Temperature: -55℃~+155℃
RN1-RN4 = 4D03WGJ0221T5E: 电阻器数:4;阻值:220Ω;精度:±5%;单个元件功率:62.5mW;温度系数:±200ppm/℃;; Manufacturer: UNI-ROYAL(厚声); AddInBom: yes; ModelId: edf39f9a2dca4b9a94267f442dd4f95a; ModelName: R0603-8P_L3.2-W1.6-H0.6; ModelTransform: 125.984,62.992,0,0,0,0,0,0,0; Number of Resistors: 4; Tolerance: ±5%; Power(Watts): 62.5mW; Symbol: 4D03WGJ0221T5E; Device: 4D03WGJ0221T5E; LCSC Part Name: 220Ω ±5%; SupplierPart: C29719; ManufacturerPart: 4D03WGJ0221T5E; Supplier Footprint: 0603x4; JLCPCB Part Class: 扩展库; Datasheet: https://item.szlcsc.com/datasheet/4D03WGJ0221T5E/30473.html; Supplier: LCSC; ConvertToPcb: yes; FootprintName: RES-ARRAY-SMD_0603-8P-L3.2-W1.6-BL; Value: 220Ω; Temperature Coefficient: ±200ppm/℃; Number of Pins: 8
SW1 = TS-1088-AR02016: 电路结构:单刀单掷;按钮形状:圆形按钮;作用力:1.6N;安装方式:立贴;开关长度:4mm;开关宽度:3mm;开关高度:2mm;带支架:不带支架;触点电流:50mA;额定电压:12V;工作寿命:10万次;; Manufacturer: XUNPU(讯普); AddInBom: yes; ModelId: b26698b69f274ffabef8a26c7d0e5dd1; ModelName: SW-SMD_L3.9-W2.9-H2.0-LS4.8; ModelTransform: 188.976,114.174,0,0,0,0,0,0,0; Circuit: 单刀单掷; Actuator Style: 圆形按钮; Operating Force: 1.6N; Switch Height: 2mm; with Bracket: 不带支架; Contact Current: 50mA; Voltage Rating: 12V; Actuator/Cap Color: 黑色; Life: 10万次; Symbol: TS-1088-AR02016; Device: TS-1088-AR02016; LCSC Part Name: 4*3*2mm 立贴 轻触开关; SupplierPart: C720477; ManufacturerPart: TS-1088-AR02016; Supplier Footprint: SMD,4x3mm; JLCPCB Part Class: 基础库; Datasheet: https://item.szlcsc.com/datasheet/TS-1088-AR02016/763484.html; Supplier: LCSC; ConvertToPcb: yes; FootprintName: SW-SMD_L3.9-W3.0-P4.45; Mounting Type: 立贴; Length: 4mm; Width: 3mm; Termination Style: SMD接片; Operating Temperature: -30℃~+80℃
U1 = PCA9685PW,118: 类型:-;工作电压(DC):2.3V~5.5V;开关频率:100kHz~1MHz;通道数:16;输出电压:-;输出电流:25mA;调光:PWM;; Manufacturer: NXP(恩智浦); AddInBom: yes; ModelId: 2653d05941624065b56b5b4ae8ee5d77; ModelName: TSSOP-28_L9.7-W4.4-H1.0-LS6.4-P0.65; ModelTransform: 251.969,381.89,0,0,0,0,-0.001,0,0; Number of Channels: 16; Output Current: 25mA; Dimming: PWM; Symbol: PCA9685PW,118; Device: PCA9685PW,118; LCSC Part Name: 16通道、12位PWM Fm+ I2C总线LED控制器; SupplierPart: C2678753; ManufacturerPart: PCA9685PW,118; Supplier Footprint: TSSOP-28; JLCPCB Part Class: 扩展库; Datasheet: https://www.nxp.com.cn/docs/en/data-sheet/PCA9685.pdf; Supplier: LCSC; ConvertToPcb: yes; FootprintName: TSSOP-28_L9.7-W4.4-P0.65-LS6.4-TL; Type: -; Voltage - Input(DC): 2.3V~5.5V; Frequency - Switching: 100kHz~1MHz; Output Voltage: -; Operating temperature: -40℃~+85℃
U2-U4 U13 = HX PZ2.54-4x3P ZZ: 插针结构:4x3P;间距:2.54mm;行距:2.54mm;圆针/方针:方针;安装方式:直插;排数:四排;总PIN位数:12P;额定电流:3A;额定电压:1kV;配合针长度:6mm;塑高:2.5mm;端接针长度:3mm;触头材质:黄铜;触头镀层:金;工作温度:-40℃~+105℃;颜色:黑色;; Manufacturer: hanxia(韩下); Convert to PCB: yes; ModelId: cb3e7cf726e9417590a1527ebd818fe4; ModelTransform: 300.3931,393.7,0,0,0,0,0,0,-118.11; Pin Structure: 4x3P; Pitch: 2.54mm; Circluar Pins/Square Pins: 方针; Current Rating: 3A; Voltage Rating (Max): 1kV; Symbol: HX PZ2.54-4X3P ZZ; Device: HX PZ2.54-4x3P ZZ; LCSC Part Name: 4x3P 间距:2.54mm 方针 直插; SupplierPart: C32713297; ManufacturerPart: HX PZ2.54-4x3P ZZ; Supplier Footprint: 插件,P=2.54mm; JLCPCB Part Class: 扩展库; Datasheet: https://item.szlcsc.com/datasheet/HX%2520PZ2.54-4x3P%2520ZZ/34444577.html; Supplier: LCSC; AddInBom: yes; FootprintName: HDR-TH_12P-P2.54-V-M-R4-C3-S2.54; ModelName: HDR-TH_12P-P2.54-V-M-R4-C3-S2.54; Row Spacing: 2.54mm; Mounting Type: 直插; Number of Rows: 四排; Number of Pins: 12P; Length of Mating Pin: 6mm; Insulation Height: 2.5mm; Length of End Connection Pin: 3mm; Contact Material: 黄铜; Contact Plating: 金; Operating Temperature: -40℃~+105℃; Color: 黑色; Supplementary Features: -
U5 = PZ2.54-2*20: 插针结构:2x20P;间距:2.54mm;行距:2.54mm;圆针/方针:方针;安装方式:直插;排数:双排;总PIN位数:40P;额定电流:2.5A;配合针长度:6mm;塑高:2.54mm;端接针长度:3mm;触头材质:黄铜;触头镀层:金;工作温度:-40℃~+105℃;; Manufacturer: ZHOURI(洲日); AddInBom: yes; ModelId: 2f697d2f705a4509bdac70452e51b3cc0819f05c4eef4c71ace90d822a990e87; ModelName: HDR-TH_40P-P2.54-M-LI-2X20P; ModelTransform: 1999.996,196.85,0,0,0,0,0,0,-118.11; Pin Structure: 2x20P; Pitch: 2.54mm; Circluar Pins/Square Pins: 方针; Current Rating: 2.5A; Symbol: PZ2.54-2*20; Device: PZ2.54-2*20; LCSC Part Name: 2x20P 间距:2.54mm 方针 直插; SupplierPart: C5224014; ManufacturerPart: PZ2.54-2*20; Supplier Footprint: 插件,P=2.54mm; JLCPCB Part Class: Extended Part; Datasheet: https://item.szlcsc.com/datasheet/PZ2.54-2*20/5925193.html; Supplier: LCSC; ConvertToPcb: yes; FootprintName: HDR-TH_40P-P2.54-V-M-R2-C20-S2.54; Row Spacing: 2.54mm; Mounting Type: 直插; Number of Rows: 双排; Number of Pins: 40P; Length of Mating Pin: 6mm; Insulation Height: 2.54mm; Length of End Connection Pin: 3mm; Contact Material: 黄铜; Contact Plating: 金; Operating Temperature: -40℃~+105℃
U6 = ARDUINO UNO R3: AddInBom: yes; Device: ARDUINO UNO R3; ConvertToPcb: yes; SymbolName: ARDUINO UNO R3
U8 = PCA9306DCUR: 数据速率:-;工作电压(VCCA):1.2V~3.3V;工作电压(VCCB):1.8V~5.5V;通道数:1;每个电路通道数:2;; Manufacturer: TI(德州仪器); AddInBom: yes; ModelId: 0897d9a9aab64803ba8a74d2c6df32aa0819f05c4eef4c71ace90d822a990e87; ModelTransform: 122.047,78.74,0,0,0,0,0,0,0; Channel Type: 双向; Number of Circuits: 2; Output Type: 开漏；推挽式; Symbol: PCA9306DCUR; Device: PCA9306DCUR; LCSC Part Name: 2位双向电平转换器; SupplierPart: C33196; ManufacturerPart: PCA9306DCUR; Supplier Footprint: VSSOP-8; JLCPCB Part Class: Extended Part; Datasheet: https://www.ti.com/cn/lit/gpn/pca9306; Supplier: LCSC; ConvertToPcb: yes; FootprintName: SSOP-8_L2.0-W2.3-P0.50-LS3.1-BR; ModelName: SSOP-8_L2.0-W2.3-P0.50-LS3.1-BR; Input Signal: -; Output Signal: -; Data Rate: -; Voltage - Supply(VCCA): 1.2V~3.3V; Voltage - Supply(VCCB): 1.8V~5.5V; Operating Temperature: -40℃~+85℃; Features: 自动方向检测
U9 = WAFER-PH2.0-4PWZ: 插针结构:1x4P;间距:2mm;安装方式:弯插;参考系列:PH;总PIN数:4P;排数:1;每排PIN数:4;行距:-;额定电流:2A;触头材质:黄铜;触头镀层:锡;工作温度:-25℃~+85℃;; Manufacturer: XUNPU(讯普); AddInBom: yes; ModelId: bb9b3511031a4727a1ade5e7dc96748b0819f05c4eef4c71ace90d822a990e87; ModelTransform: 394.0937,248.031,0,0,0,0,0,-114.173,-137.795; Pins Structure: 1x4P; Pitch: 2mm; Reference Series: PH; Number of PINs Per Row: 4; Current Rating: 2A; Voltage Rating: 250V; Plastic Material: PA66; Flame Retardant Rating: UL94V-0; Z-Height of the Board: 4.7mm; X-Length of Bottom Edge on Board (Spacing Line): 10mm; Y-Width of Bottom Edge on Board: 6.05mm; Symbol: WAFER-PH2.0-4PWZ; Device: WAFER-PH2.0-4PWZ; LCSC Part Name: 1x4P 间距:2mm 弯插 系列:PH; SupplierPart: C5359612; ManufacturerPart: WAFER-PH2.0-4PWZ; Supplier Footprint: 弯插,P=2mm; JLCPCB Part Class: Extended Part; Datasheet: https://item.szlcsc.com/datasheet/WAFER-PH2.0-4PWZ/6173848.html; Supplier: LCSC; ConvertToPcb: yes; FootprintName: CONN-TH_4P-P2.00_BX-PH2.0-4PWZ; ModelName: CONN-TH_4P-P2.00_BX-PH2.0-4PWZ; Mounting Type: 弯插; Number of Pins: 4P; Number of Rows: 1; Row Spacing: -; Contact Material: 黄铜; Contact Plating: 锡; Operating Temperature: -25℃~+85℃; Supplementary Features: -; Color: 白色
U10 = TPS63060DSCR: 功能类型:升降压型;输出类型:可调;工作电压:2.5V~12V;输出电压:2.5V~8V;输出电流:2A;; Manufacturer: TI(德州仪器); AddInBom: yes; Function: 升降压型; Output Type: 可调; Output Current: 2A; Switching Frequency: 2.4MHz; Synchronous Rectification: 是; Number of Outputs: 1; Topology: 降压-升压式; Switch tube (built-in/external): 内置; Symbol: TPS63060DSCR; Device: TPS63060DSCR; LCSC Part Name: 高输入电压升降压转换器; SupplierPart: C48567; ManufacturerPart: TPS63060DSCR; Supplier Footprint: WSON-10-EP(3x3); JLCPCB Part Class: 扩展库; Datasheet: https://www.ti.com/cn/lit/gpn/tps63060; Supplier: LCSC; ConvertToPcb: yes; FootprintName: WSON-10_L3.0-W3.0-P0.50-BL-EP-A; Input Voltage: 2.5V~12V; Output Voltage: 2.5V~8V; Operating Temperature: -40℃~+85℃@(TA)
U11 = CH340C: 应用功能:收发器;USB协议版本:USB 2.0;数据速率:2Mbps;; Manufacturer: WCH(南京沁恒); AddInBom: yes; ModelId: 3361a6792abf4a8f8fbca4f1924a67ee; ModelName: SOP-16_L9.9-W3.9-H1.5-LS6.0-P1.27; ModelTransform: 240.39054,393.7,0,90,0,0,0,0,0; Applications Function: 收发器; USB Protocol: USB 2.0; Voltage - Supply: 3.3V；5V; Data Rate: 2Mbps; Current - Supply: 7mA; Supply Current (Iq): 50uA; Symbol: CH340C; Device: CH340C; LCSC Part Name: USB转串口芯片; SupplierPart: C84681; ManufacturerPart: CH340C; Supplier Footprint: SOP-16; JLCPCB Part Class: 扩展库; Datasheet: https://item.szlcsc.com/datasheet/CH340C/85852.html; Supplier: LCSC; ConvertToPcb: yes; FootprintName: SOP-16_L10.0-W3.9-P1.27-LS6.0-BL; Operating Temperature: -20℃~+70℃
U12 = HC-PM254-8.5H-2x4PW-02A: 插孔结构:2x4P;间距:2.54mm;行距:2.54mm;圆孔/方孔:方孔;安装方式:弯插;排数:双排;总孔位数:8P;额定电流:3A;额定电压:-;插孔方向:侧面;塑高:5mm;触头材质:黄铜;触头镀层:金;工作温度:-40℃~+105℃;; Manufacturer: HC(虹成电子); AddInBom: yes; ModelId: f917cbc22de94efda54142024782371f; ModelTransform: 416.1409,499.999,0,0,0,0,0.001,-190.945,-125.984; Holes Structure: 2x4P; Pitch: 2.54mm; Circular Hole / Square Hole: 方孔; Number of Positions: 8P; Current Rating: 3A; Holes Direction: 侧面; PIN Length: 3mm; Symbol: HC-PM254-8.5H-2X4PW-02A; Device: HC-PM254-8.5H-2x4PW-02A; LCSC Part Name: 间距2.54mm 2x4Pin 弯插 PC3.2 PB12.7 H8.5; SupplierPart: C42163146; ManufacturerPart: HC-PM254-8.5H-2x4PW-02A; Supplier Footprint: 弯插,P=2.54mm; JLCPCB Part Class: 扩展库; Datasheet: https://item.szlcsc.com/datasheet/HC-PM254-8.5H-2x4PW-02A/44033135.html; Supplier: LCSC; ConvertToPcb: yes; FootprintName: HDR-TH_8P-P2.54-H-F-R2-C4-S2.54-W8.5; ModelName: HDR-TH_8P-P2.54-H-F-R2-C4-S2.54-W8.5; Row Spacing: 2.54mm; Mounting Type: 弯插; Number of Rows: 双排; Voltage Rating (Max): -; Insulation Height: 5mm; Contact Material: 黄铜; Contact Plating: 金; Operating Temperature: -40℃~+105℃; Supplementary Features: -
U14 = XT60PB-M.G.Y: Manufacturer: AMASS(艾迈斯); AddInBom: yes; ModelId: c4c5e22dc09643cc9d2346cb05dc93040819f05c4eef4c71ace90d822a990e87; ModelTransform: 629.92,318.897,0,0,0,0,0,0,-157.48; Symbol: XT60PB-M.G.Y; Device: XT60PB-M.G.Y; LCSC Part Name: XT60PB 20A双芯PCB直插公金黄; SupplierPart: C19268037; ManufacturerPart: XT60PB-M.G.Y; Supplier Footprint: -; JLCPCB Part Class: Extended Part; Datasheet: https://item.szlcsc.com/datasheet/XT60PB-M.G.Y/20526048.html; Supplier: LCSC; ConvertToPcb: yes; FootprintName: CONN-TH_XT60PB-M; ModelName: CONN-TH_XT60PB-M
USB1 = TYPE-C 16PIN 2MD(073): 连接器类型:Type-C;协议标准:-;公母:母;安装方式:卧贴;触点数量:16P;端口数量:1;额定电流 - 电源:3A;工作温度:-25℃~+85℃;; Manufacturer: SHOU HAN(首韩); AddInBom: yes; ModelId: 3a41b9ec9b654a0fad4d118405ec6290; ModelTransform: 351.9678,298.4246,0,0,0,0,0,-47.244,-35.433; Gender: 母; Number of Contacts: 16P; Number of Ports: 1; Current Rating-Power: 3A; Voltage Rating: 5V; Connect-Disconnect Life: 5千次; Detection color: 黑色; Symbol: TYPE-C 16PIN 2MD(073); Device: TYPE-C 16PIN 2MD(073); LCSC Part Name: Type-C 母 卧贴; SupplierPart: C2765186; ManufacturerPart: TYPE-C 16PIN 2MD(073); Supplier Footprint: SMD; JLCPCB Part Class: 扩展库; Datasheet: https://item.szlcsc.com/datasheet/TYPE-C%252016PIN%25202MD(073)/2901843.html; Supplier: LCSC; ConvertToPcb: yes; FootprintName: USB-C-SMD_TYPE-C-6PIN-2MD-073; ModelName: USB-C-SMD_TYPE-C-6PIN-2MD-073; Connector Type: Type-C; Protocol Standard: -; Mounting Type: 卧贴; Supplementary Features: -; Center Height: -; Length: -; Operating Temperature: -25℃~+85℃